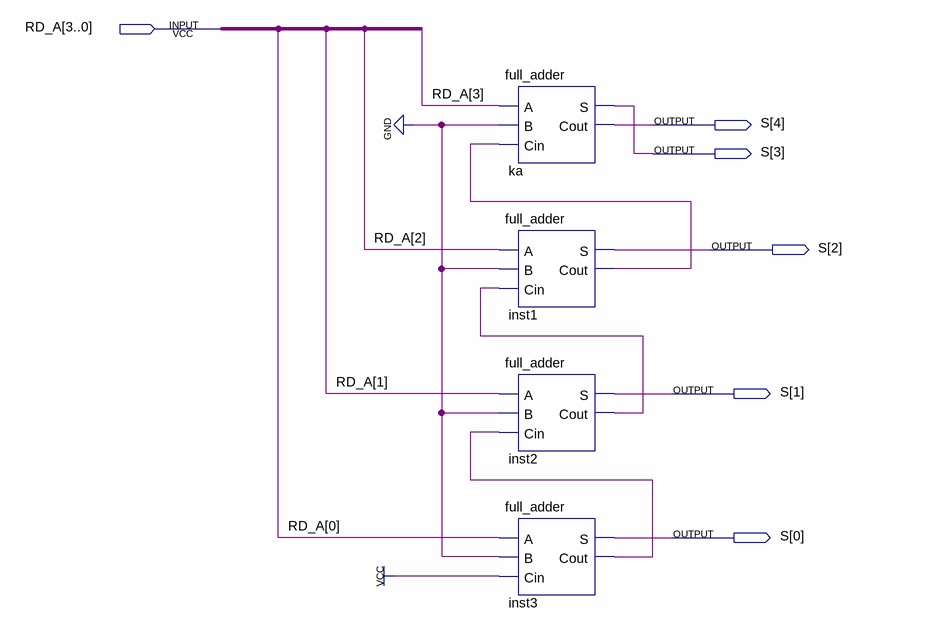
[diagram p0: schematic sheet]
// Quartus schematic incre_1.bdf as structural Verilog: 4 symbols, 6 pins
module incre_1 (
  input  [3:0] RD_A,
  output [4:0] S
);

  wire inst1_cout, inst2_cout, inst3_cout;

  full_adder ka (.A(RD_A[3]), .B(1'b0), .Cin(inst1_cout), .S(S[3]), .Cout(S[4]));
  full_adder inst1 (.A(RD_A[2]), .B(1'b0), .Cin(inst2_cout), .S(S[2]), .Cout(inst1_cout));
  full_adder inst2 (.A(RD_A[1]), .B(1'b0), .Cin(inst3_cout), .S(S[1]), .Cout(inst2_cout));
  full_adder inst3 (.A(RD_A[0]), .B(1'b0), .Cin(1'b1), .S(S[0]), .Cout(inst3_cout));
endmodule
